# Altium schematic sheet RootSheet.SchDoc
size A; SheetNumber: 1; SheetTotal: 6
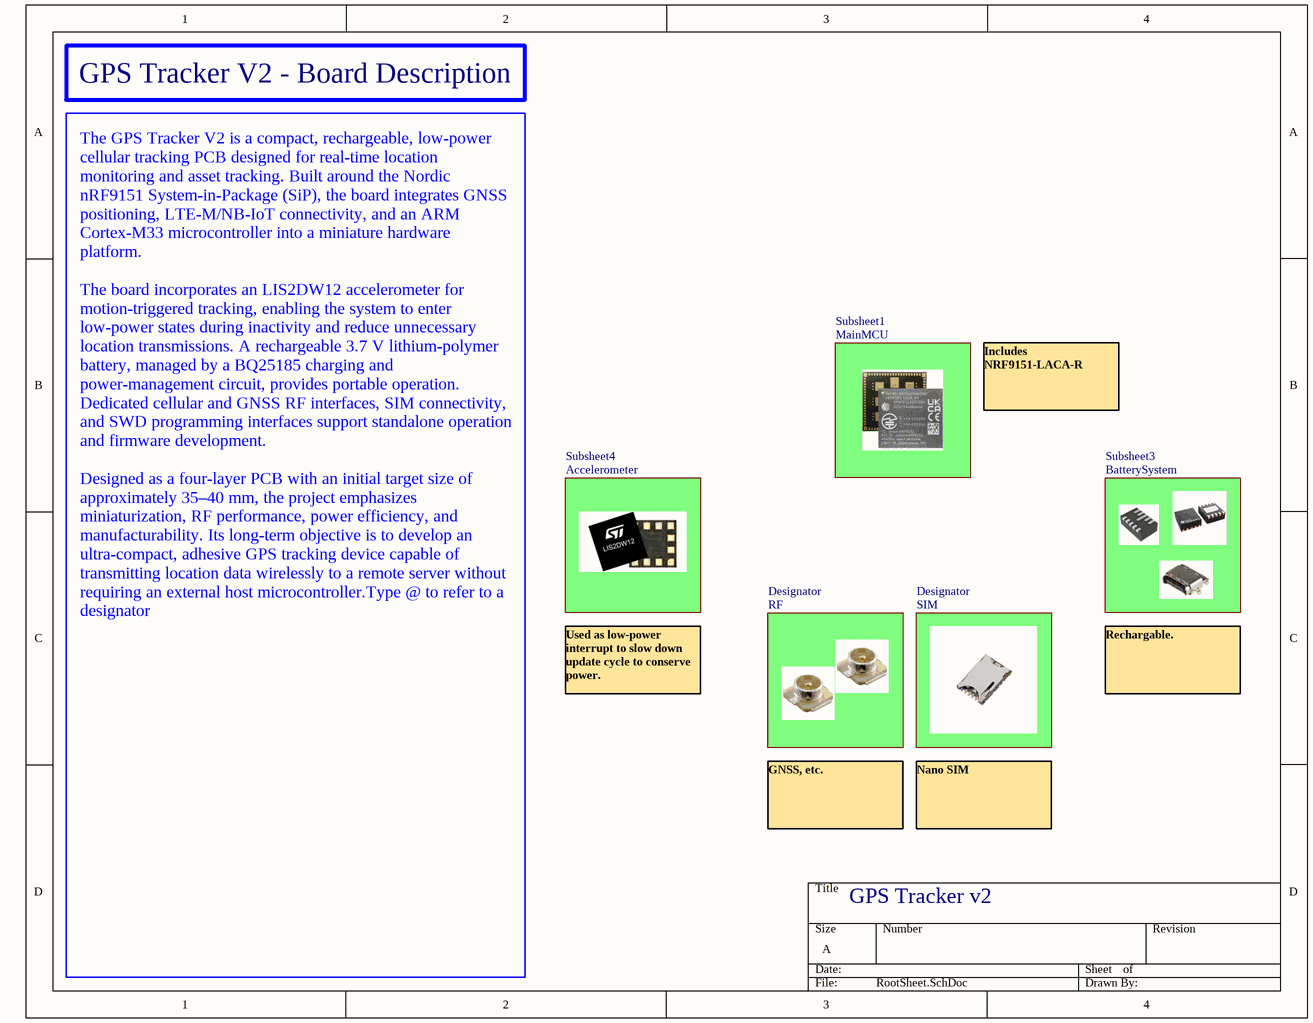
[diagram p0: RootSheet.SchDoc]

## Sub-sheets
Designator = RF: no entries
Designator = SIM: no entries
Subsheet1 = MainMCU: no entries
Subsheet3 = BatterySystem: no entries
Subsheet4 = Accelerometer: no entries

## Notes on the sheet
- GPS Tracker V2 - Board Description
- Includes NRF9151-LACA-R
- Used as low-power interrupt to slow down update cycle to conserve power.
- Rechargable.
- GNSS, etc.
- Nano SIM
- GPS Tracker v2
- The GPS Tracker V2 is a compact, rechargeable, low-power cellular tracking PCB designed for real-time location monitoring and asset tracking. Built around the Nordic nRF9151 System-in-Package (SiP), the board integrates GNSS positioning, LTE-M/NB-IoT connectivity, and an ARM Cortex-M33 microcontroller into a miniature hardware platform.
  The board incorporates an LIS2DW12 accelerometer for motion-triggered tracking, enabling the system to enter low-power states during inactivity and reduce unnecessary location transmissions. A rechargeable 3.7 V lithium-polymer battery, managed by a BQ25185 charging and power-management circuit, provides portable operation. Dedicated cellular and GNSS RF interfaces, SIM connectivity, and SWD programming interfaces support standalone operation and firmware development.
  Designed as a four-layer PCB with an initial target size of approximately 35–40 mm, the project emphasizes miniaturization, RF performance, power efficiency, and manufacturability. Its long-term objective is to develop an ultra-compact, adhesive GPS tracking device capable of transmitting location data wirelessly to a remote server without requiring an external host microcontroller.Type @ to refer to a designator